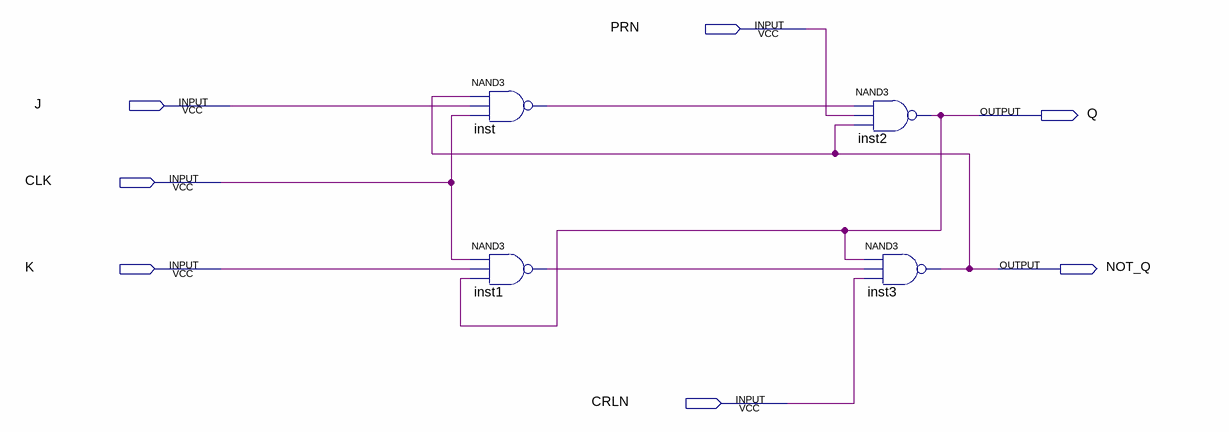
[diagram p0: schematic sheet]
// Quartus schematic flip_flop_JK_Preset_Clear.bdf as structural Verilog: 4 symbols, 7 pins
module flip_flop_JK_Preset_Clear (
  input  PRN,
  input  J,
  input  CLK,
  input  K,
  input  CRLN,
  output Q,
  output NOT_Q
);

  wire inst1_out, inst_out;

  nand inst (inst_out, NOT_Q, J, CLK);
  nand inst1 (inst1_out, CLK, K, Q);
  nand inst2 (Q, inst_out, PRN, NOT_Q);
  nand inst3 (NOT_Q, Q, inst1_out, CRLN);
endmodule
